# Altium schematic sheet TOP.SchDoc: TOP
size A4; Author: Silvio Navaretti; CompanyName: Arduino srl; DocumentNumber: ABX00063; Revision: V1.2; SheetNumber: 1; SheetTotal: 8; RevAuthor: Silvio Navaretti
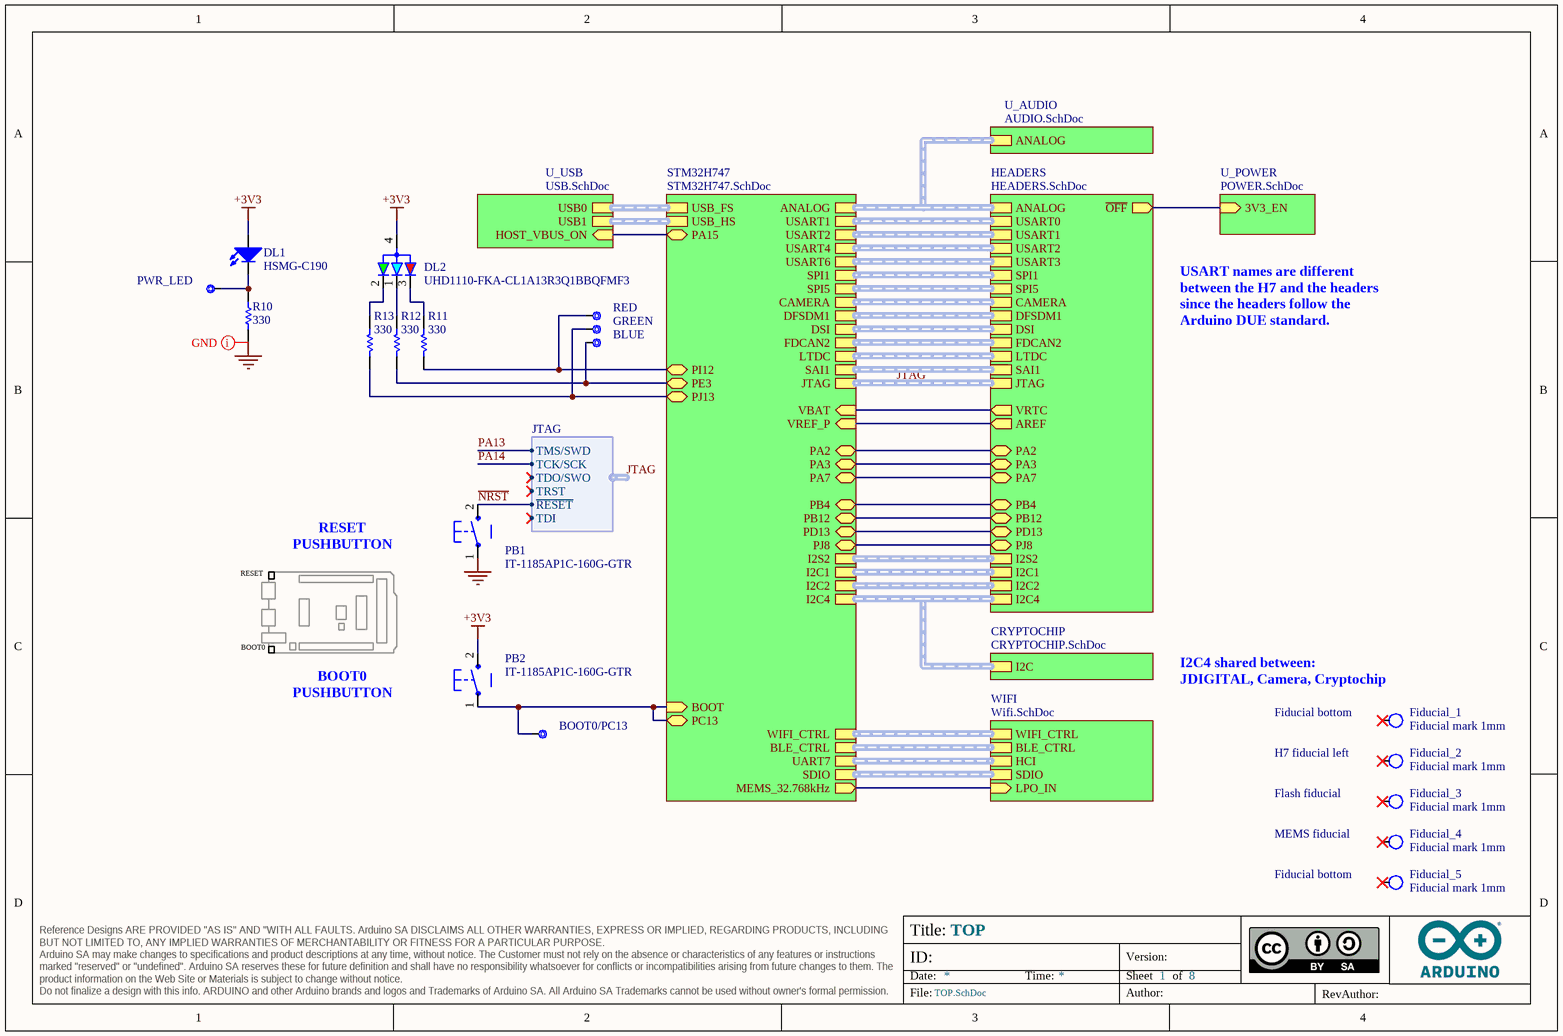
[diagram p0: TOP.SchDoc]

## Parts
BLUE  CMP-018-0005-A.3  [TP-1.00MM]  (value not drawn)  (no BOM)
BOOT0/PC13  CMP-018-0005-A.3  [TP-1.00MM]  (value not drawn)  (no BOM)
DL1  HSMG-C190  [LEDC1608X80N-AK]
DL2  UHD1110-FKA-CL1A13R3Q1BBQFMF3  [UHD1110-FKA-CL1A13R3Q1BBQFMF3]
Fiducial_1  Fiducial mark 1mm  [Fiducial mark 1mm-Footprint-1]  (no BOM)
Fiducial_2  Fiducial mark 1mm  [Fiducial mark 1mm-Footprint-1]  (no BOM)
Fiducial_3  Fiducial mark 1mm  [Fiducial mark 1mm-Footprint-1]  (no BOM)
Fiducial_4  Fiducial mark 1mm  [Fiducial mark 1mm-Footprint-1]  (no BOM)
Fiducial_5  Fiducial mark 1mm  [Fiducial mark 1mm-Footprint-1]  (no BOM)
GREEN  CMP-018-0005-A.3  [TP-1.00MM]  (value not drawn)  (no BOM)
PB1  IT-1185AP1C-160G-GTR  [C&K_PTS820_NO_HOLES-1]
PB2  IT-1185AP1C-160G-GTR  [C&K_PTS820_NO_HOLES-1]
PWR_LED  CMP-018-0005-A.3  [TP-1.00MM]  (value not drawn)  (no BOM)
R10  value 330  [RES-0402]  (hidden comment: CRCW0402330RJNED)
R11  value 330  [RES-0402]  (hidden comment: CRCW0402330RJNED)
R12  value 330  [RES-0402]  (hidden comment: CRCW0402330RJNED)
R13  value 330  [RES-0402]  (hidden comment: CRCW0402330RJNED)
RED  CMP-018-0005-A.3  [TP-1.00MM]  (value not drawn)  (no BOM)

## Sub-sheets
CRYPTOCHIP = CRYPTOCHIP.SchDoc: I2C (harness I2C)
HEADERS = HEADERS.SchDoc: SPI5 (harness SPI), PB4 (bidir), I2C1 (harness I2C), LTDC (harness LTDC), SAI1 (harness SAI), I2C4 (harness I2C), USART0 (harness UART), USART3 (harness UART), USART2 (harness UART), USART1 (harness UART), I2C2 (harness I2C), PD13 (bidir), PA7 (bidir), PJ8 (bidir), PA2 (bidir), PA3 (bidir), ANALOG (harness ANALOG), FDCAN2 (harness FDCAN), I2S2 (harness I2S), DSI (harness DISPLAY), DFSDM1 (harness DFSDM), SPI1 (harness SPI), CAMERA (harness ARDUCAM), AREF (out), ~{OFF} (out), VRTC (out), JTAG (harness JTAG), PB12 (bidir)
STM32H747 = STM32H747.SchDoc: BOOT (in), DSI (harness DISPLAY), VREF_P (in), SDIO (harness SDC), USB_FS (harness USB), USB_HS (harness USB), PI12 (bidir), PE3 (bidir), PJ13 (bidir), UART7 (harness UART), PC13 (bidir), I2C1 (harness I2C), USART1 (harness UART), USART6 (harness UART), USART4 (harness UART), USART2 (harness UART), I2C2 (harness I2C), ANALOG (harness ANALOG), FDCAN2 (harness FDCAN), LTDC (harness LTDC), SAI1 (harness SAI), I2S2 (harness I2S), DFSDM1 (harness DFSDM), I2C4 (harness I2C), CAMERA (harness ARDUCAM), SPI5 (harness SPI), SPI1 (harness SPI), BLE_CTRL (harness BLE CTRL), WIFI_CTRL (harness WiFi CTRL), PD13 (bidir), PB4 (bidir), PA7 (bidir), PJ8 (bidir), PA2 (bidir), PA3 (bidir), JTAG (harness JTAG), PB12 (bidir), VBAT (in), MEMS_32.768kHz (out), PA15 (bidir)
U_AUDIO = AUDIO.SchDoc: ANALOG (harness ANALOG)
U_POWER = POWER.SchDoc: 3V3_EN (in)
U_USB = USB.SchDoc: USB0 (harness USB), USB1 (harness USB), HOST_VBUS_ON (in)
WIFI = Wifi.SchDoc: BLE_CTRL (harness BLE CTRL), HCI (harness UART), WIFI_CTRL (harness WiFi CTRL), SDIO (harness SDC), LPO_IN (in)

## Harnesses
JTAG: ~{RESET}, TCK/SCK, TDI, TDO/SWO, TMS/SWD, TRST

## Nets
+3V3: DL1.A DL2.4(ANODE) PB2.2
GND: PB1.1 R10.1
~{NRST}: PB1.2 ; sheet STM32H747/JTAG.~{RESET}  [project net JTAG.~{RESET}]
PA13: sheet STM32H747/JTAG.TMS/SWD  [project net JTAG.TMS/SWD]
PA14: sheet STM32H747/JTAG.TCK/SCK  [project net JTAG.TCK/SCK]
NetBLUE_X: BLUE.X R12.2 ; sheet STM32H747/PE3
NetBOOT0/PC13_X: BOOT0/PC13.X PB2.1 ; sheet STM32H747/BOOT, sheet STM32H747/PC13
NetDL1_C: DL1.C PWR_LED.X R10.2
NetDL2_1: DL2.1(BLUE_C) R12.1
NetDL2_2: DL2.2(GREEN_C) R13.1
NetDL2_3: DL2.3(RED_C) R11.1
NetGREEN_X: GREEN.X R13.2 ; sheet STM32H747/PJ13
NetR11_2: R11.2 RED.X ; sheet STM32H747/PI12
(unnamed): sheet U_POWER/3V3_EN, sheet HEADERS/~{OFF}
(unnamed): sheet U_USB/HOST_VBUS_ON, sheet STM32H747/PA15
(unnamed): sheet STM32H747/VREF_P, sheet HEADERS/AREF
(unnamed): sheet STM32H747/PD13, sheet HEADERS/PD13
(unnamed): sheet STM32H747/PB4, sheet HEADERS/PB4
(unnamed): sheet STM32H747/PA7, sheet HEADERS/PA7
(unnamed): sheet STM32H747/PJ8, sheet HEADERS/PJ8
(unnamed): sheet STM32H747/PA2, sheet HEADERS/PA2
(unnamed): sheet STM32H747/PA3, sheet HEADERS/PA3
(unnamed): sheet STM32H747/PB12, sheet HEADERS/PB12
(unnamed): sheet STM32H747/VBAT, sheet HEADERS/VRTC
(unnamed): sheet STM32H747/MEMS_32.768kHz, sheet WIFI/LPO_IN

Not connected (* = marked no-connect by the designer): Fiducial_1 1*; Fiducial_2 1*; Fiducial_3 1*; Fiducial_4 1*; Fiducial_5 1*

## Buses and harness runs
harness JTAG = sheet HEADERS/JTAG = sheet STM32H747/JTAG
harness sheet CRYPTOCHIP/I2C = sheet HEADERS/I2C4 = sheet STM32H747/I2C4
harness sheet HEADERS/ANALOG = sheet STM32H747/ANALOG = sheet U_AUDIO/ANALOG
harness sheet HEADERS/CAMERA = sheet STM32H747/CAMERA
harness sheet HEADERS/DFSDM1 = sheet STM32H747/DFSDM1
harness sheet HEADERS/DSI = sheet STM32H747/DSI
harness sheet HEADERS/FDCAN2 = sheet STM32H747/FDCAN2
harness sheet HEADERS/I2C1 = sheet STM32H747/I2C1
harness sheet HEADERS/I2C2 = sheet STM32H747/I2C2
harness sheet HEADERS/I2S2 = sheet STM32H747/I2S2
harness sheet HEADERS/LTDC = sheet STM32H747/LTDC
harness sheet HEADERS/SAI1 = sheet STM32H747/SAI1
harness sheet HEADERS/SPI1 = sheet STM32H747/SPI1
harness sheet HEADERS/SPI5 = sheet STM32H747/SPI5
harness sheet HEADERS/USART0 = sheet STM32H747/USART1
harness sheet HEADERS/USART1 = sheet STM32H747/USART2
harness sheet HEADERS/USART2 = sheet STM32H747/USART4
harness sheet HEADERS/USART3 = sheet STM32H747/USART6
harness sheet STM32H747/BLE_CTRL = sheet WIFI/BLE_CTRL
harness sheet STM32H747/SDIO = sheet WIFI/SDIO
harness sheet STM32H747/UART7 = sheet WIFI/HCI
harness sheet STM32H747/USB_FS = sheet U_USB/USB0
harness sheet STM32H747/USB_HS = sheet U_USB/USB1
harness sheet STM32H747/WIFI_CTRL = sheet WIFI/WIFI_CTRL

## Layout directives
net class GND: GND

## Notes on the sheet
- USART names are different between the H7 and the headers since the headers follow the Arduino DUE standard.
- RESET
- RESET
  PUSHBUTTON
- BOOT0
- BOOT0
  PUSHBUTTON
- (near Fiducial_1) I2C4 shared between:
  JDIGITAL, Camera, Cryptochip
- (near Fiducial_1) Fiducial bottom
- (near Fiducial_2) H7 fiducial left
- Flash fiducial
- MEMS fiducial
- Fiducial bottom
- Title:
- ID:
- Date:
- Time:
- Version:
- Sheet
- of
- RevAuthor:
- Reference Designs ARE PROVIDED "AS IS" AND "WITH ALL FAULTS. Arduino SA DISCLAIMS ALL OTHER WARRANTIES, EXPRESS OR IMPLIED, REGARDING PRODUCTS, INCLUDING BUT NOT LIMITED TO, ANY IMPLIED WARRANTIES OF MERCHANTABILITY OR FITNESS FOR A PARTICULAR PURPOSE.
  Arduino SA may make changes to specifications and product descriptions at any time, without notice. The Customer must not rely on the absence or characteristics of any features or instructions marked "reserved" or "undefined". Arduino SA reserves these for future definition and shall have no responsibility whatsoever for conflicts or incompatibilities arising from future changes to them. The product information on the Web Site or Materials is subject to change without notice.
  Do not finalize a design with this info. ARDUINO and other Arduino brands and logos and Trademarks of Arduino SA. All Arduino SA Trademarks cannot be used without owner's formal permission.
- File:
- Author:

## Library data of the parts
BLUE BOOT0/PC13 GREEN PWR_LED RED = UT0013-A.4: Test point 1.00mm; Design Item ID: CMP-018-0005-A.3; Source: ut.SchLib; Pin Count: 1
DL1 = L0009-A.5: LED SMD 0603 GREEN/568 15mcd 120^; Manufacturer: Broadcom; Code Arduino: 2204; Part Number: HSMG-C190; Pin Count: 2
DL2 = L0026-A.4: LED RGB BLACK BODY SMD; Manufacturer: Cree LED; Code Arduino: L0026; Part Number: UHD1110-FKA-CL1A13R3Q1BBQFMF3; Pin Count: 4
Fiducial_1-Fiducial_5 = UT0023-A.6: Fiducial mark 1mm clearance 2mm
PB1 PB2 = B0001-A.7: PUSHBUTTON WHITE NO ANCHORS; Manufacturer: Switronic; Code Arduino: 0173; Part Number: IT-1185AP1C-160G-GTR; Mount: SMT; Color: White
R10-R13 = R0017-A.23: RES CHIP 0402 330R 5% 1/16W; Manufacturer: Vishay; Power: 62.5mW; Code Arduino: 2229; Temperature coefficient: 200ppm; Tolerance: 5%; Part Number: CRCW0402330RJNED; Case Code (Imperial): 0402; Technology: Thick film